# Altium schematic sheet 3PDT_Board.SchDoc
size A4; SheetNumber: 2; SheetTotal: 2
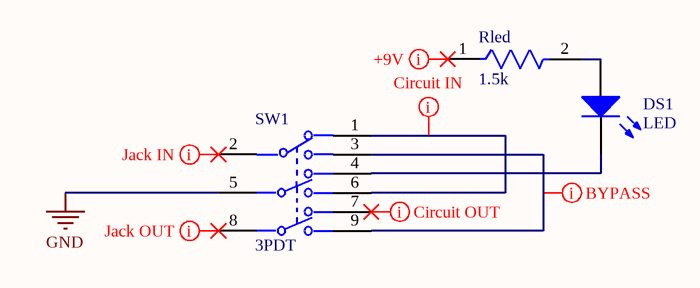
[diagram p0: 3PDT_Board.SchDoc]

## Parts
DS1  LED  [EVRL-IR333C]
Rled  1.5k  [FP-CFR-25-MFG]
SW1  3PDT  [FP-FS57003PLT2B2M1QE-MFG]

## Nets
GND: SW1.5
NetDS1_1: DS1.1(A) Rled.2
NetDS1_2: DS1.2(K) SW1.4
NetSW1_1: SW1.1 SW1.6
NetSW1_3: SW1.3 SW1.9

Not connected (* = marked no-connect by the designer): Rled 1*; SW1 2* 7* 8*

## Layout directives
mark named Circuit IN: NetSW1_1
mark named Circuit OUT: NetSW1_7
mark named BYPASS: NetSW1_3
mark named Jack OUT: NetSW1_8
mark named Jack IN: NetSW1_2
mark named +9V: NetRled_1

## Library data of the parts
DS1 = CMP-2000-05108-1: Infrared LED, 1.2 V, -40 to 85 degC, 2-Pin Radial, RoHS, Bulk; Manufacturer: Everlight Electronics; Viewing Angle: 40deg; Power Rating: 150mW; Maximum Forward Current: 1A; Brand: Everlight; Operating Voltage: 1.2V; Wavelength: 940nm; Radiant Intensity: 12mW/sr; Lens Shape: Dome; Forward Current: 20mA; Datasheet URL: http://www.everlight.com/file/ProductFile/201407061521223111.pdf; Manufacturer URL: http://www.everlight.com/; Mounting Style: ThroughHole; Factory Pack Quantity: 500; RoHS: Details; Illumination Color: Infrared; Package / Case: T-13/4; Forward Voltage: 1.2V; Minimum Operating Temperature: -40C; Product Category: InfraredEmitters; Datasheet Version: May-13; Maximum Operating Temperature: +85C
Rled = CMP-03413-000009-1: RES 10 OHM 1/4W 5% AXIAL; Resistance: 10R; Temperature Coefficient: 500ppm/°C; Max Power Dissipation: 250mW; RoHS Compliant: Yes; Packaging: Bulk; Series: Carbon Film; Case/Package: Axial; Max Operating Temperature: 155°C; Min Operating Temperature: -55°C; Number of Terminations: 2; Length: 0.248inch; Resistor Type: Carbon Film; Tolerance: 5%; Package Quantity: 200
SW1 = CMP-17874-000002-1: SWITCH PUSHBUTTON 3PDT 1A 9V; Manufacturer Part Number: FS57003PLT2B2M1QE; Manufacturer: E-Switch; Electromechanical Life: 30000Cycles; Contact Resistance: 50mΩ; Operating Force: 3000gf; Footprint Url: https://sten-eswitch-13110800-production.s3.amazonaws.com/system/asset/product_line/data_sheet/226/FS5700.pdf; Mount: Through Hole; Temperature Range Low: -10°C; Lead Free: Yes; Temperature Range High: +70°C; Device Class L3: Pushbutton Switches; Digikey Description: SWITCH PUSHBUTTON 3PDT 1A 9V; ComponentLink2URL: http://spec_sheets.e-switch.com/specs/ST790000.pdf; Contact Current Rating: 1A; Category: Switch; Height: 39.2mm; RoHS: TRUE; Octopart: https://octopart.com/fs57003plt2b2m1qe-e-switch-81236038; Throw Configuration: 3PDT; Device Class L2: Switches; Device Class L1: Electromechanical; Package: FS57003PLT2B2M1QE; Temperature: -10°C to +70°C; ComponentLink2Description: Datasheet; Voltage Rating Dc: 9V; Automotive: No